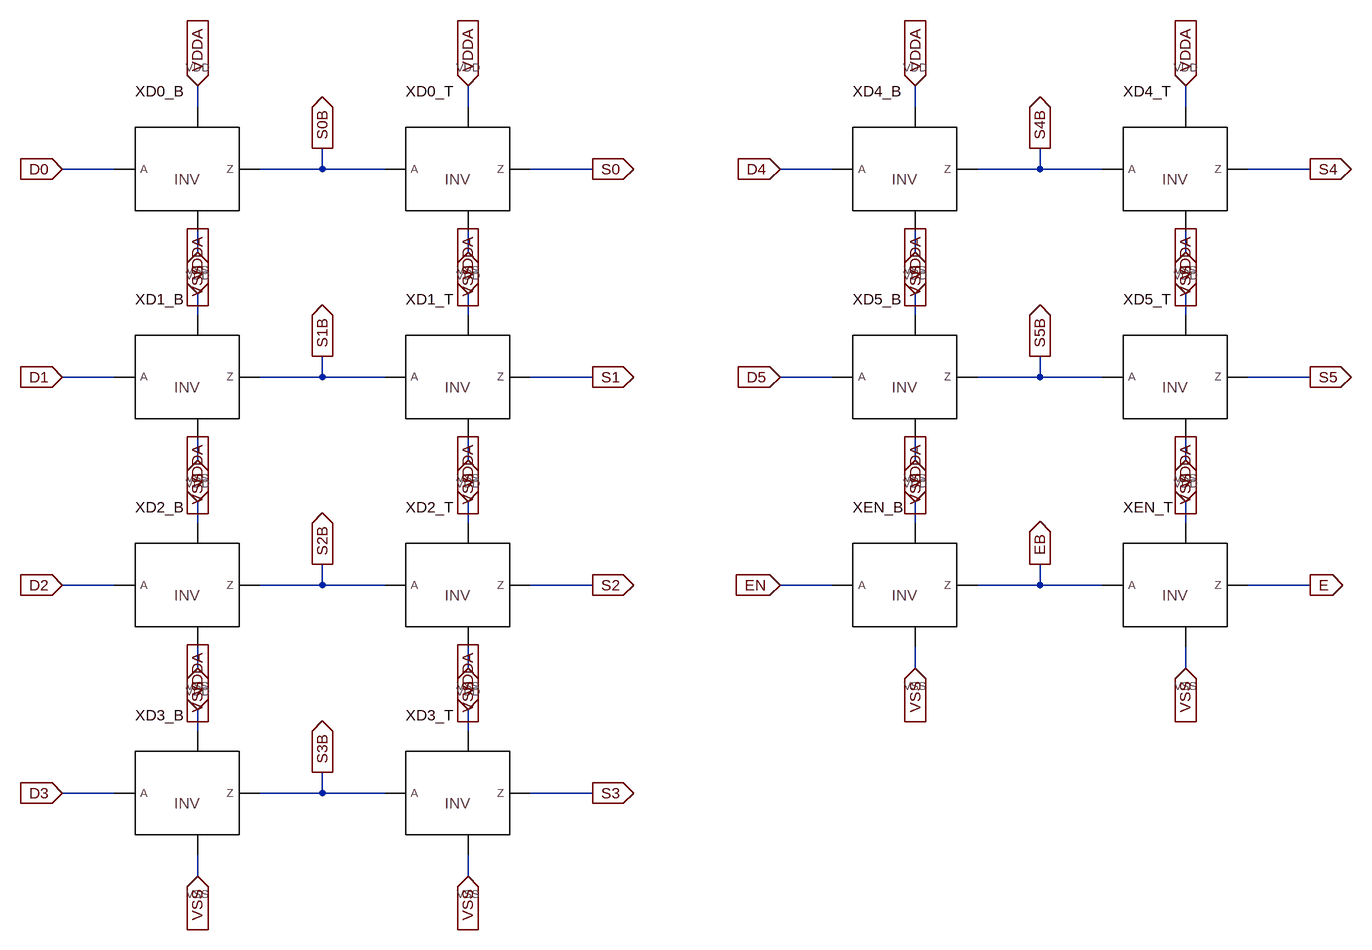
[diagram p0: schematic DAC_Control.asc]
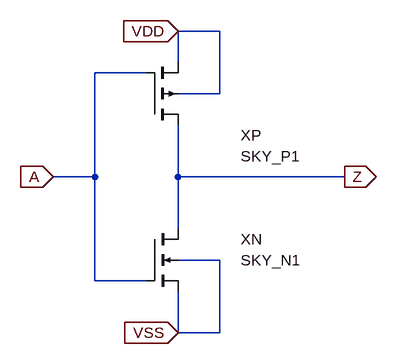
[diagram p1: sub-circuit cmos_inv.asc]
DAC_Control.asc, the LTspice schematic file:
Version 4.1
SHEET 1 2176 1440
WIRE 192 192 112 192
WIRE 512 192 416 192
WIRE 608 192 512 192
WIRE 512 160 512 192
WIRE 928 192 832 192
WIRE 320 96 320 64
WIRE 320 320 320 288
WIRE 736 96 736 64
WIRE 736 320 736 288
WIRE 192 512 112 512
WIRE 512 512 416 512
WIRE 608 512 512 512
WIRE 512 480 512 512
WIRE 928 512 832 512
WIRE 320 416 320 384
WIRE 320 640 320 608
WIRE 736 416 736 384
WIRE 736 640 736 608
WIRE 192 832 112 832
WIRE 512 832 416 832
WIRE 608 832 512 832
WIRE 512 800 512 832
WIRE 928 832 832 832
WIRE 320 736 320 704
WIRE 320 960 320 928
WIRE 736 736 736 704
WIRE 736 960 736 928
WIRE 192 1152 112 1152
WIRE 512 1152 416 1152
WIRE 608 1152 512 1152
WIRE 512 1120 512 1152
WIRE 928 1152 832 1152
WIRE 320 1056 320 1024
WIRE 320 1280 320 1248
WIRE 736 1056 736 1024
WIRE 736 1280 736 1248
WIRE 1296 192 1216 192
WIRE 1616 192 1520 192
WIRE 1712 192 1616 192
WIRE 1616 160 1616 192
WIRE 2032 192 1936 192
WIRE 1424 96 1424 64
WIRE 1424 320 1424 288
WIRE 1840 96 1840 64
WIRE 1840 320 1840 288
WIRE 1296 512 1216 512
WIRE 1616 512 1520 512
WIRE 1712 512 1616 512
WIRE 1616 480 1616 512
WIRE 2032 512 1936 512
WIRE 1424 416 1424 384
WIRE 1424 640 1424 608
WIRE 1840 416 1840 384
WIRE 1840 640 1840 608
WIRE 1296 832 1216 832
WIRE 1616 832 1520 832
WIRE 1712 832 1616 832
WIRE 1616 800 1616 832
WIRE 2032 832 1936 832
WIRE 1424 736 1424 704
WIRE 1424 960 1424 928
WIRE 1840 736 1840 704
WIRE 1840 960 1840 928
FLAG 112 192 D0
IOPIN 112 192 In
FLAG 512 160 S0B
IOPIN 512 160 Out
FLAG 928 192 S0
IOPIN 928 192 Out
FLAG 320 64 VDDA
IOPIN 320 64 In
FLAG 320 320 VSS
IOPIN 320 320 In
FLAG 736 64 VDDA
IOPIN 736 64 In
FLAG 736 320 VSS
IOPIN 736 320 In
FLAG 112 512 D1
IOPIN 112 512 In
FLAG 512 480 S1B
IOPIN 512 480 Out
FLAG 928 512 S1
IOPIN 928 512 Out
FLAG 320 384 VDDA
IOPIN 320 384 In
FLAG 320 640 VSS
IOPIN 320 640 In
FLAG 736 384 VDDA
IOPIN 736 384 In
FLAG 736 640 VSS
IOPIN 736 640 In
FLAG 112 832 D2
IOPIN 112 832 In
FLAG 512 800 S2B
IOPIN 512 800 Out
FLAG 928 832 S2
IOPIN 928 832 Out
FLAG 320 704 VDDA
IOPIN 320 704 In
FLAG 320 960 VSS
IOPIN 320 960 In
FLAG 736 704 VDDA
IOPIN 736 704 In
FLAG 736 960 VSS
IOPIN 736 960 In
FLAG 112 1152 D3
IOPIN 112 1152 In
FLAG 512 1120 S3B
IOPIN 512 1120 Out
FLAG 928 1152 S3
IOPIN 928 1152 Out
FLAG 320 1024 VDDA
IOPIN 320 1024 In
FLAG 320 1280 VSS
IOPIN 320 1280 In
FLAG 736 1024 VDDA
IOPIN 736 1024 In
FLAG 736 1280 VSS
IOPIN 736 1280 In
FLAG 1216 192 D4
IOPIN 1216 192 In
FLAG 1616 160 S4B
IOPIN 1616 160 Out
FLAG 2032 192 S4
IOPIN 2032 192 Out
FLAG 1424 64 VDDA
IOPIN 1424 64 In
FLAG 1424 320 VSS
IOPIN 1424 320 In
FLAG 1840 64 VDDA
IOPIN 1840 64 In
FLAG 1840 320 VSS
IOPIN 1840 320 In
FLAG 1216 512 D5
IOPIN 1216 512 In
FLAG 1616 480 S5B
IOPIN 1616 480 Out
FLAG 2032 512 S5
IOPIN 2032 512 Out
FLAG 1424 384 VDDA
IOPIN 1424 384 In
FLAG 1424 640 VSS
IOPIN 1424 640 In
FLAG 1840 384 VDDA
IOPIN 1840 384 In
FLAG 1840 640 VSS
IOPIN 1840 640 In
FLAG 1216 832 EN
IOPIN 1216 832 In
FLAG 1616 800 EB
IOPIN 1616 800 Out
FLAG 2032 832 E
IOPIN 2032 832 Out
FLAG 1424 704 VDDA
IOPIN 1424 704 In
FLAG 1424 960 VSS
IOPIN 1424 960 In
FLAG 1840 704 VDDA
IOPIN 1840 704 In
FLAG 1840 960 VSS
IOPIN 1840 960 In
SYMBOL blocks\\CMOS_INV 192 96 R0
SYMATTR InstName XD0_B
SYMBOL blocks\\CMOS_INV 608 96 R0
SYMATTR InstName XD0_T
SYMBOL blocks\\CMOS_INV 192 416 R0
SYMATTR InstName XD1_B
SYMBOL blocks\\CMOS_INV 608 416 R0
SYMATTR InstName XD1_T
SYMBOL blocks\\CMOS_INV 192 736 R0
SYMATTR InstName XD2_B
SYMBOL blocks\\CMOS_INV 608 736 R0
SYMATTR InstName XD2_T
SYMBOL blocks\\CMOS_INV 192 1056 R0
SYMATTR InstName XD3_B
SYMBOL blocks\\CMOS_INV 608 1056 R0
SYMATTR InstName XD3_T
SYMBOL blocks\\CMOS_INV 1296 96 R0
SYMATTR InstName XD4_B
SYMBOL blocks\\CMOS_INV 1712 96 R0
SYMATTR InstName XD4_T
SYMBOL blocks\\CMOS_INV 1296 416 R0
SYMATTR InstName XD5_B
SYMBOL blocks\\CMOS_INV 1712 416 R0
SYMATTR InstName XD5_T
SYMBOL blocks\\CMOS_INV 1296 736 R0
SYMATTR InstName XEN_B
SYMBOL blocks\\CMOS_INV 1712 736 R0
SYMATTR InstName XEN_T

cmos_inv.asc, the sub-circuit schematic file:
Version 4.1
SHEET 1 960 704
WIRE 352 192 352 272
WIRE 352 272 352 352
WIRE 352 272 608 272
WIRE 304 112 224 112
WIRE 224 112 224 272
WIRE 224 272 224 432
WIRE 224 432 304 432
WIRE 224 272 160 272
WIRE 352 96 352 48
WIRE 352 144 416 144
WIRE 416 144 416 48
WIRE 416 48 352 48
WIRE 352 448 352 512
WIRE 352 400 416 400
WIRE 416 400 416 512
WIRE 416 512 352 512
FLAG 608 272 Z
IOPIN 608 272 Out
FLAG 160 272 A
IOPIN 160 272 In
FLAG 352 48 VDD
IOPIN 352 48 In
FLAG 352 512 VSS
IOPIN 352 512 In
SYMBOL pmos4 304 192 M180
WINDOW 0 144 -16 Left 2
WINDOW 3 144 -48 Left 2
SYMATTR InstName XP
SYMATTR Value SKY_P1
SYMATTR SpiceLine w=1 l=0.15 mult=2
SYMATTR Prefix X
SYMBOL nmos4 304 352 R0
WINDOW 0 144 16 Left 2
WINDOW 3 144 48 Left 2
SYMATTR InstName XN
SYMATTR Value SKY_N1
SYMATTR SpiceLine w=1 l=0.15 mult=1
SYMATTR Prefix X

The netlist it stands for:
* DAC_Control.asc
X§XD0_B D0 S0B VDDA VSS cmos_inv
X§XD0_T S0B S0 VDDA VSS cmos_inv
X§XD1_B D1 S1B VDDA VSS cmos_inv
X§XD1_T S1B S1 VDDA VSS cmos_inv
X§XD2_B D2 S2B VDDA VSS cmos_inv
X§XD2_T S2B S2 VDDA VSS cmos_inv
X§XD3_B D3 S3B VDDA VSS cmos_inv
X§XD3_T S3B S3 VDDA VSS cmos_inv
X§XD4_B D4 S4B VDDA VSS cmos_inv
X§XD4_T S4B S4 VDDA VSS cmos_inv
X§XD5_B D5 S5B VDDA VSS cmos_inv
X§XD5_T S5B S5 VDDA VSS cmos_inv
X§XEN_B EN EB VDDA VSS cmos_inv
X§XEN_T EB E VDDA VSS cmos_inv

* block symbol definitions
.subckt cmos_inv A Z VDD VSS
X§XP Z A VDD VDD SKY_P1 w=1 l=0.15 mult=2  ; pins D G S B
X§XN Z A VSS VSS SKY_N1 w=1 l=0.15 mult=1  ; pins D G S B
.ends cmos_inv

.backanno
.end